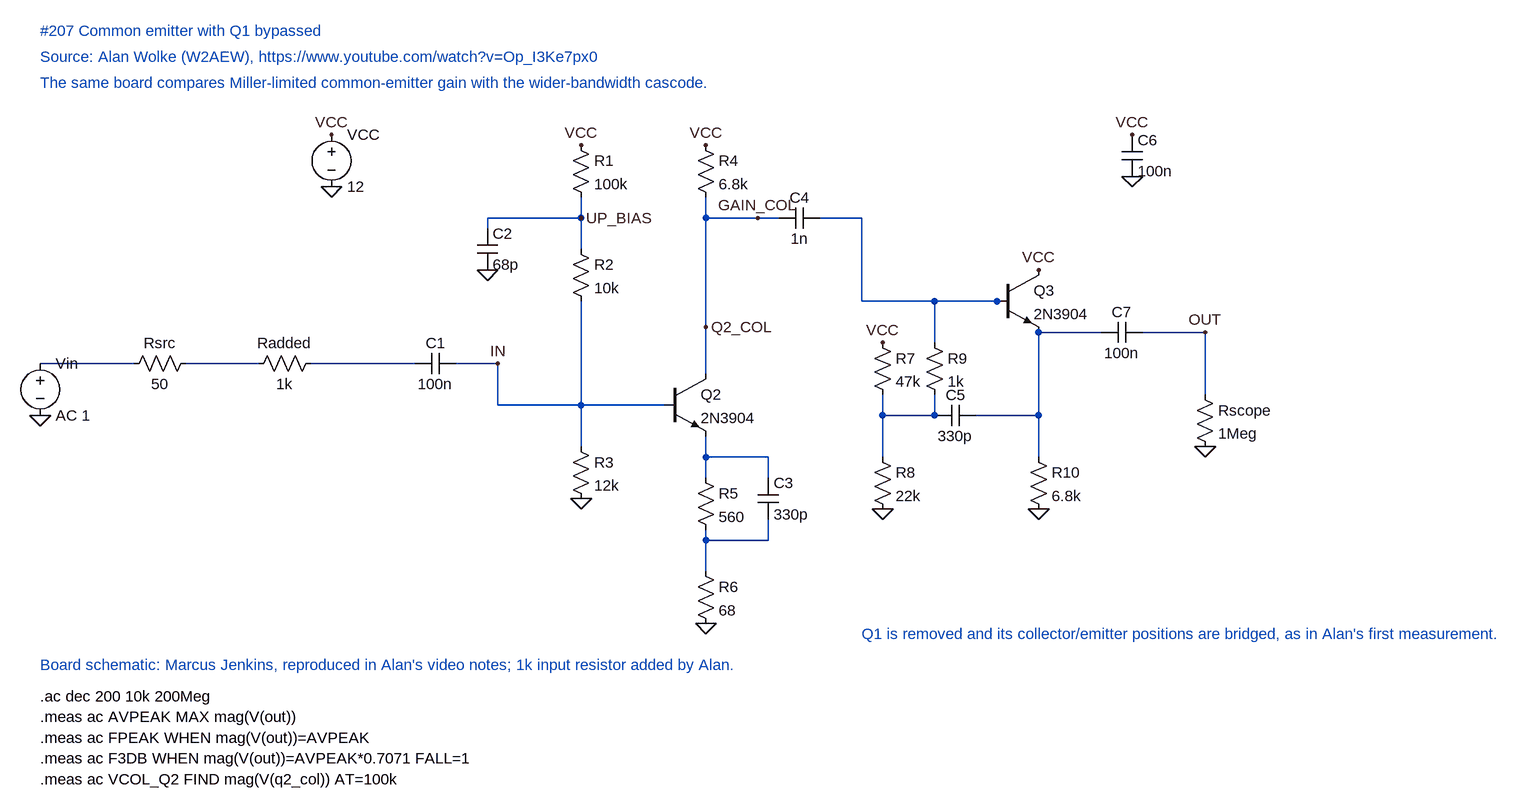
[diagram p0: schematic Common emitter with Q1 bypassed.asc]
Common emitter with Q1 bypassed.asc, the LTspice schematic file:
Version 4
SHEET 1 1600 1150
SYMBOL voltage -512 176 R0
SYMATTR InstName VCC
SYMATTR Value 12
FLAG -512 192 VCC
FLAG -512 272 0
SYMBOL voltage -960 528 R0
SYMATTR InstName Vin
SYMATTR Value AC 1
FLAG -960 624 0
SYMBOL res -720 528 R90
WINDOW 0 0 56 VBottom 2
WINDOW 3 32 56 VTop 2
SYMATTR InstName Rsrc
SYMATTR Value 50
WIRE -960 544 -816 544
SYMBOL res -528 528 R90
WINDOW 0 0 56 VBottom 2
WINDOW 3 32 56 VTop 2
SYMATTR InstName Radded
SYMATTR Value 1k
WIRE -736 544 -624 544
SYMBOL cap -320 528 R90
WINDOW 0 0 32 VBottom 2
WINDOW 3 32 32 VTop 2
SYMATTR InstName C1
SYMATTR Value 100n
WIRE -544 544 -384 544
WIRE -320 544 -256 544
FLAG -256 544 IN
SYMBOL res -144 192 R0
SYMATTR InstName R1
SYMATTR Value 100k
FLAG -128 208 VCC
WIRE -128 288 -128 320
FLAG -128 320 UP_BIAS
SYMBOL res -144 352 R0
SYMATTR InstName R2
SYMATTR Value 10k
WIRE -128 320 -128 368
WIRE -128 448 -128 608
WIRE -128 608 0 608
SYMBOL res -144 656 R0
SYMATTR InstName R3
SYMATTR Value 12k
WIRE -128 608 -128 672
FLAG -128 752 0
SYMBOL cap -288 336 R0
SYMATTR InstName C2
SYMATTR Value 68p
WIRE -272 320 -128 320
WIRE -272 320 -272 336
FLAG -272 400 0
SYMBOL npn 0 560 R0
SYMATTR InstName Q2
SYMATTR Value 2N3904
WIRE -256 544 -256 608
WIRE -256 608 -128 608
WIRE 64 656 64 720
SYMBOL res 48 704 R0
SYMATTR InstName R5
SYMATTR Value 560
SYMBOL res 48 848 R0
SYMATTR InstName R6
SYMATTR Value 68
WIRE 64 800 64 864
FLAG 64 944 0
SYMBOL cap 144 720 R0
SYMATTR InstName C3
SYMATTR Value 330p
WIRE 64 688 160 688
WIRE 160 688 160 720
WIRE 64 816 160 816
WIRE 160 784 160 816
SYMBOL res 48 192 R0
SYMATTR InstName R4
SYMATTR Value 6.8k
FLAG 64 208 VCC
WIRE 64 288 64 320
WIRE 64 320 64 560
TEXT 304 960 Left 2 ;Q1 is removed and its collector/emitter positions are bridged, as in Alan's first measurement.
FLAG 144 320 GAIN_COL
FLAG 64 488 Q2_COL
SYMBOL cap 240 304 R90
WINDOW 0 0 32 VBottom 2
WINDOW 3 32 32 VTop 2
SYMATTR InstName C4
SYMATTR Value 1n
WIRE 64 320 176 320
WIRE 240 320 304 320
WIRE 304 320 304 448
WIRE 304 448 512 448
SYMBOL npn 512 400 R0
SYMATTR InstName Q3
SYMATTR Value 2N3904
FLAG 576 400 VCC
SYMBOL res 320 496 R0
SYMATTR InstName R7
SYMATTR Value 47k
FLAG 336 512 VCC
WIRE 336 592 336 624
SYMBOL res 320 672 R0
SYMATTR InstName R8
SYMATTR Value 22k
WIRE 336 624 336 688
FLAG 336 768 0
SYMBOL res 400 496 R0
SYMATTR InstName R9
SYMATTR Value 1k
WIRE 416 448 512 448
WIRE 416 448 416 512
WIRE 416 592 416 624
WIRE 336 624 416 624
WIRE 480 624 576 624
SYMBOL cap 480 608 R90
WINDOW 0 0 32 VBottom 2
WINDOW 3 32 32 VTop 2
SYMATTR InstName C5
SYMATTR Value 330p
WIRE 576 496 576 624
SYMBOL res 560 672 R0
SYMATTR InstName R10
SYMATTR Value 6.8k
WIRE 576 624 576 688
FLAG 576 768 0
SYMBOL cap 736 480 R90
WINDOW 0 0 32 VBottom 2
WINDOW 3 32 32 VTop 2
SYMATTR InstName C7
SYMATTR Value 100n
WIRE 576 496 672 496
WIRE 736 496 832 496
FLAG 832 496 OUT
SYMBOL res 816 576 R0
SYMATTR InstName Rscope
SYMATTR Value 1Meg
WIRE 832 496 832 592
FLAG 832 672 0
SYMBOL cap 704 192 R0
SYMATTR InstName C6
SYMATTR Value 100n
FLAG 720 192 VCC
FLAG 720 256 0
TEXT -960 32 Left 2 ;#207 Common emitter with Q1 bypassed
TEXT -960 72 Left 2 ;Source: Alan Wolke (W2AEW), https://www.youtube.com/watch?v=Op_I3Ke7px0
TEXT -960 112 Left 2 ;The same board compares Miller-limited common-emitter gain with the wider-bandwidth cascode.
TEXT -960 1008 Left 2 ;Board schematic: Marcus Jenkins, reproduced in Alan's video notes; 1k input resistor added by Alan.
TEXT -960 1056 Left 2 !.ac dec 200 10k 200Meg
TEXT -960 1088 Left 2 !.meas ac AVPEAK MAX mag(V(out))
TEXT -960 1120 Left 2 !.meas ac FPEAK WHEN mag(V(out))=AVPEAK
TEXT -960 1152 Left 2 !.meas ac F3DB WHEN mag(V(out))=AVPEAK*0.7071 FALL=1
TEXT -960 1184 Left 2 !.meas ac VCOL_Q2 FIND mag(V(q2_col)) AT=100k

The netlist it stands for:
* Common emitter with Q1 bypassed.asc
VCC VCC 0 12
Vin N001 0 AC 1
Rsrc N002 N001 50
Radded N003 N002 1k
C1 IN N003 100n
R1 VCC UP_BIAS 100k
R2 UP_BIAS IN 10k
R3 IN 0 12k
C2 UP_BIAS 0 68p
Q2 Q2_COL IN N004 0 2N3904
R5 N004 N005 560
R6 N005 0 68
C3 N004 N005 330p
R4 VCC Q2_COL 6.8k
C4 N006 Q2_COL 1n
Q3 VCC N006 N008 0 2N3904
R7 VCC N007 47k
R8 N007 0 22k
R9 N006 N007 1k
C5 N008 N007 330p
R10 N008 0 6.8k
C7 OUT N008 100n
Rscope OUT 0 1Meg
C6 VCC 0 100n
.model NPN NPN
.model PNP PNP
.lib standard.bjt
* Q1 is removed and its collector/emitter positions are bridged, as in Alan's first measurement.
* #207 Common emitter with Q1 bypassed
* Source: Alan Wolke (W2AEW), https://www.youtube.com/watch?v=Op_I3Ke7px0
* The same board compares Miller-limited common-emitter gain with the wider-bandwidth cascode.
* Board schematic: Marcus Jenkins, reproduced in Alan's video notes; 1k input resistor added by Alan.
.ac dec 200 10k 200Meg
.meas ac AVPEAK MAX mag(V(out))
.meas ac FPEAK WHEN mag(V(out))=AVPEAK
.meas ac F3DB WHEN mag(V(out))=AVPEAK*0.7071 FALL=1
.meas ac VCOL_Q2 FIND mag(V(q2_col)) AT=100k
.backanno
.end